# Altium schematic sheet gripper_control.SchDoc
size A4; SheetNumber: 1; SheetTotal: 1
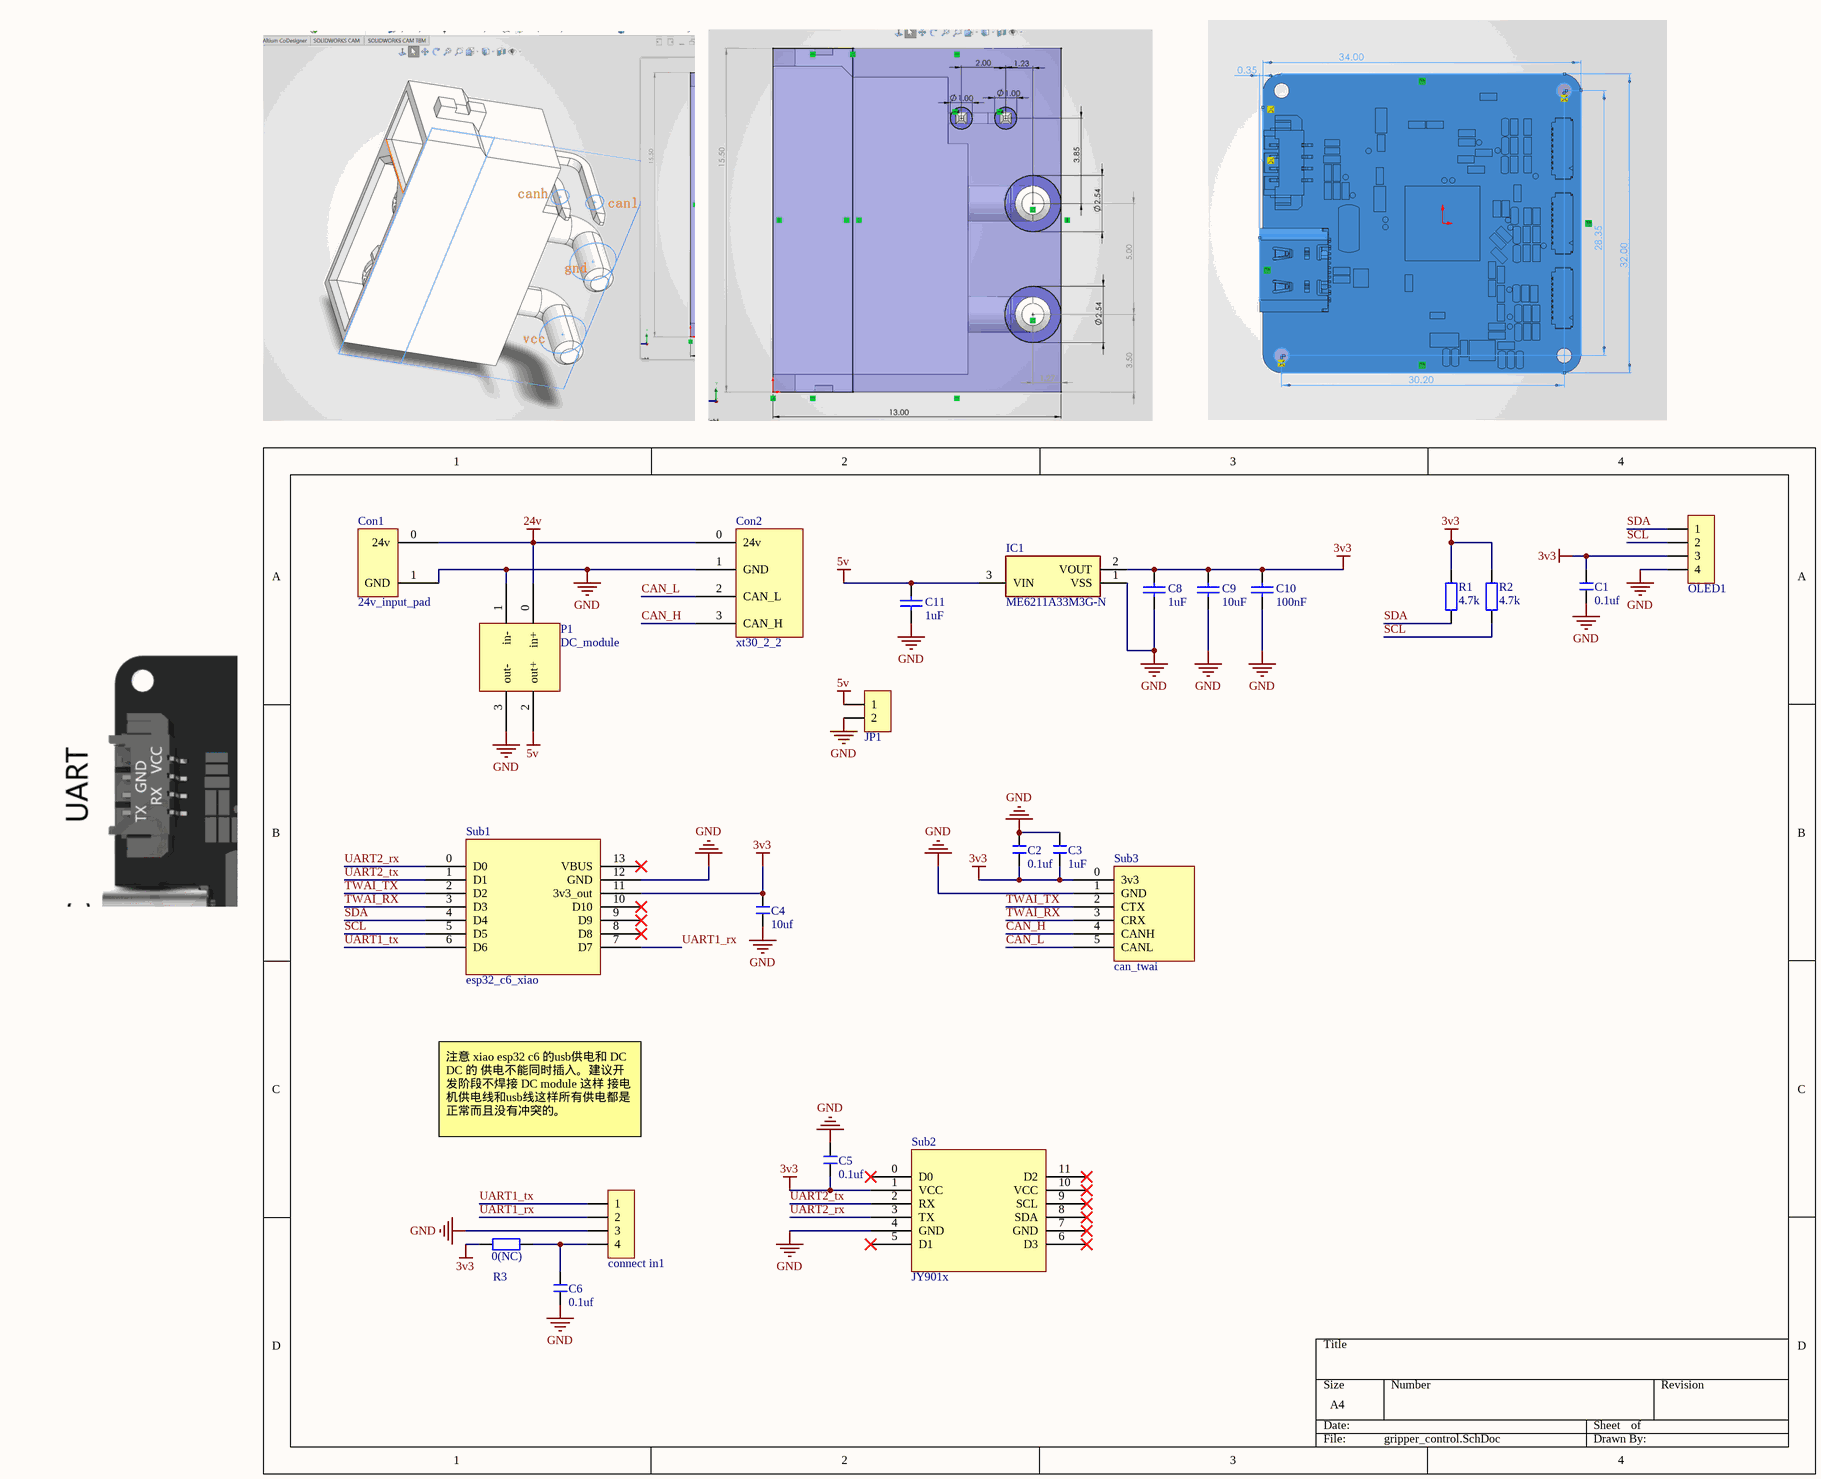
[diagram p0: gripper_control.SchDoc]

## Parts
C1  0.1uf  [C 0603_L]
C2  0.1uf  [C 0603_L]
C3  1uF  [C 0603_L]
C4  10uf  [C 0603_L]
C5  0.1uf  [C 0603_L]
C6  0.1uf  [C 0603_L]
C8  1uF  [C0402_L]
C9  10uF  [C0402_L]
C10  100nF  [C0402_L]
C11  1uF  [C0402_L]
Con1  24v_input_pad  [high volt input]
Con2  xt30_2_2  [xt30_2_2]
connect_in1  HDR-1X4  [MX 1.25-WS-4P]  (value not drawn)
IC1  ME6211A33M3G-N  [SOT95P280X145-3N]
JP1  HDR-1X2  [PH2.0-WI-2P]  (value not drawn)
OLED1  HDR-1X4  [PH2.0-WS-4P]  (value not drawn)
P1  DC_module  [xibang_24v_dc]
R1  4.7k  [R 0603_L]
R2  4.7k  [R 0603_L]
R3  0(NC)  [R 0603_L]
Sub1  esp32_c6_xiao  [esp32_c6_xiao]
Sub2  JY901x  [JY901x]
Sub3  can_twai  [6pin_2.5_can]

## Nets
3v3: C1.2 C2.2 C3.2 C4.2 C5.2 C8.1 C9.1 C10.1 IC1.2(VOUT) OLED1.3 R1.2 R2.2 R3.2 Sub1.11(3v3_out) Sub2.1(VCC) Sub3.0(3v3)
5v: C11.1 IC1.3(VIN) JP1.1 P1.2(out+)
24v: Con1.0(24v) Con2.0(24v) P1.0(in+)
GND: C1.1 C2.1 C3.1 C4.1 C5.1 C6.1 C8.2 C9.2 C10.2 C11.2 Con1.1(GND) Con2.1(GND) connect_in1.3 IC1.1(VSS) JP1.2 OLED1.4 P1.1(in-) P1.3(out-) Sub1.12(GND) Sub2.4(GND) Sub3.1(GND)
CAN_H: Con2.3(CAN_H) Sub3.4(CANH)
CAN_L: Con2.2(CAN_L) Sub3.5(CANL)
SCL: OLED1.2 R2.1 Sub1.5(D5)
SDA: OLED1.1 R1.1 Sub1.4(D4)
TWAI_RX: Sub1.3(D3) Sub3.3(CRX)
TWAI_TX: Sub1.2(D2) Sub3.2(CTX)
UART1_rx: connect_in1.2 Sub1.7(D7)
UART1_tx: connect_in1.1 Sub1.6(D6)
UART2_rx: Sub1.0(D0) Sub2.3(TX)
UART2_tx: Sub1.1(D1) Sub2.2(RX)
NetC6_2: C6.2 connect_in1.4 R3.1

Not connected (* = marked no-connect by the designer): Sub1 8(D8)* 9(D9)* 10(D10)* 13(VBUS)*; Sub2 0(D0)* 5(D1)* 6(D3)* 7(GND)* 8(SDA)* 9(SCL)* 10(VCC)* 11(D2)*

## Notes on the sheet
- 注意 xiao esp32 c6 的usb供电和 DC DC 的 供电不能同时插入。建议开发阶段不焊接 DC module 这样 接电机供电线和usb线这样所有供电都是正常而且没有冲突的。

## Library data of the parts
C1-C6 = C: 无极性贴片电容; 版权归属: 源创客; BOM名称: 无极性贴片电容; 学习资源: www.ooocke.com
C8-C11 = C: 贴片电容/MLCC电容; BOM名称: 无极性贴片电容; 联系下单店铺卖家 免费帮你查找封装: 联系下单店铺卖家 免费技术指导; 当前库版本V2024.2.3 @淘宝卖家:黄晶宝石: 最新版本发布https://item.taobao.com/item.htm?id=566775463719
connect_in1 OLED1 = Header 4: 4P接插件; 版权归属: 源创客; BOM名称: 4P接插件; 学习资源: www.ooocke.com
IC1 = ME6211A33M3G-N: Integrated Circuit; Manufacturer_Name: Microne; Datasheet Link: https://www.lcsc.com/datasheet/lcsc_datasheet_1811151641_MICRONE-Nanjing-Micro-One-Elec-ME6211A33M3G-N_C168807.pdf; Height: 1.45mm; Manufacturer_Part_Number: ME6211A33M3G-N
JP1 = Header 2: 2P接插件; 版权归属: 源创客; BOM名称: 2P接插件; 学习资源: www.ooocke.com
R1-R3 = R: 贴片电阻; 版权归属: 源创客; BOM名称: 贴片电阻; 学习资源: www.ooocke.com